# Altium schematic sheet ram.SchDoc
size A3; SheetNumber: 1; SheetTotal: 1
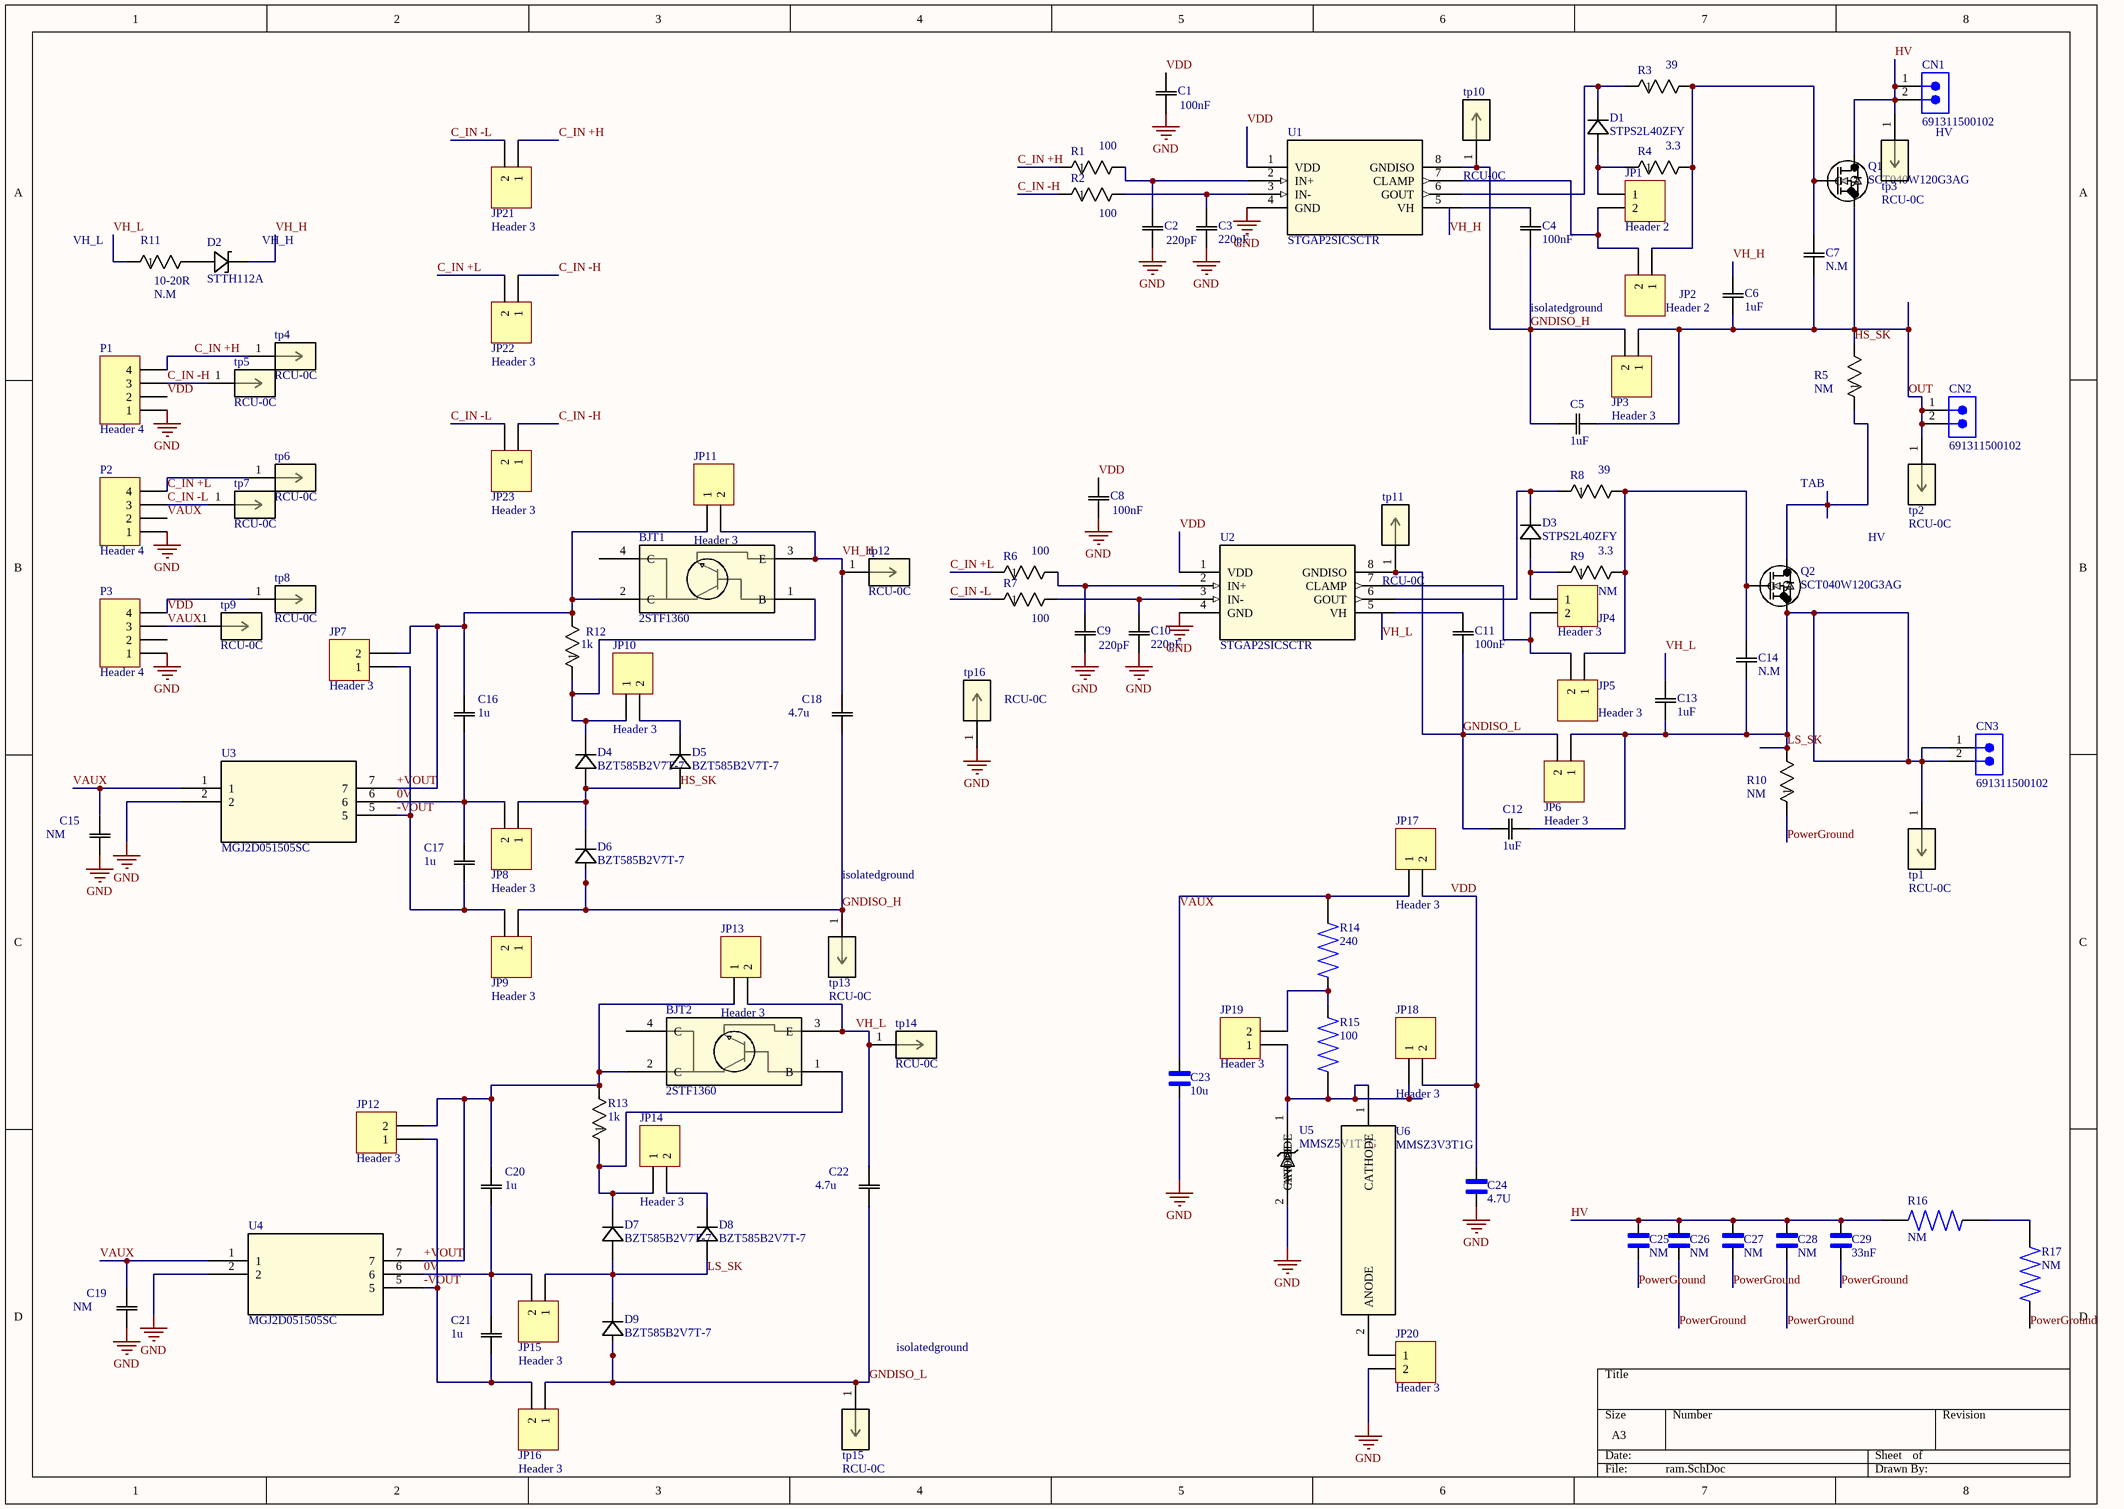
[diagram p0: ram.SchDoc]

## Parts
BJT1  2STF1360  [SOT-89_STM]
BJT2  2STF1360  [SOT-89_STM]
C1  100nF  [CAPC340180_88N_KEM]
C2  220pF  [CAPC340180_88N_KEM]
C3  220pF  [CAPC340180_88N_KEM]
C4  100nF  [CAPC340180_88N_KEM]
C5  1uF  [CAPC340180_88N_KEM]
C6  1uF  [CAPC340180_88N_KEM]
C7  N.M  [CAPC340180_88N_KEM]
C8  100nF  [CAPC340180_88N_KEM]
C9  220pF  [CAPC340180_88N_KEM]
C10  220pF  [CAPC340180_88N_KEM]
C11  100nF  [CAPC340180_88N_KEM]
C12  1uF  [CAPC340180_88N_KEM]
C13  1uF  [CAPC340180_88N_KEM]
C14  N.M  [CAPC340180_88N_KEM]
C15  NM  [CAPC340180_88N_KEM]
C16  1u  [CAPC340180_88N_KEM]
C17  1u  [CAPC340180_88N_KEM]
C18  4.7u  [CAPC340180_88N_KEM]
C19  NM  [CAPC340180_88N_KEM]
C20  1u  [CAPC340180_88N_KEM]
C21  1u  [CAPC340180_88N_KEM]
C22  4.7u  [CAPC340180_88N_KEM]
C23  10u  [CAPC3216X178]
C24  4.7U  [CAPC3216X178]
C25  NM  [CAPC3216X178]
C26  NM  [CAPC3216X178]
C27  NM  [CAPC3216X178]
C28  NM  [CAPC3216X178]
C29  33nF  [CAPC3216X178]
CN1  691311500102  [691311500102]
CN2  691311500102  [691311500102]
CN3  691311500102  [691311500102]
D1  STPS2L40ZFY  [CR_2L40ZFY_STM]
D2  STTH112A  [SMA_STM]
D3  STPS2L40ZFY  [CR_2L40ZFY_STM]
D4  BZT585B2V7T-7  [SOD523_DIO]
D5  BZT585B2V7T-7  [SOD523_DIO]
D6  BZT585B2V7T-7  [SOD523_DIO]
D7  BZT585B2V7T-7  [SOD523_DIO]
D8  BZT585B2V7T-7  [SOD523_DIO]
D9  BZT585B2V7T-7  [SOD523_DIO]
JP1  Header 2  [HDR1X2]
JP2  Header 2  [HDR1X2]
JP3  Header 3  [HDR1X2]
JP4  Header 3  [HDR1X2]
JP5  Header 3  [HDR1X2]
JP6  Header 3  [HDR1X2]
JP7  Header 3  [HDR1X2]
JP8  Header 3  [HDR1X2]
JP9  Header 3  [HDR1X2]
JP10  Header 3  [HDR1X2]
JP11  Header 3  [HDR1X2]
JP12  Header 3  [HDR1X2]
JP13  Header 3  [HDR1X2]
JP14  Header 3  [HDR1X2]
JP15  Header 3  [HDR1X2]
JP16  Header 3  [HDR1X2]
JP17  Header 3  [HDR1X2]
JP18  Header 3  [HDR1X2]
JP19  Header 3  [HDR1X2]
JP20  Header 3  [HDR1X2]
JP21  Header 3  [HDR1X2]
JP22  Header 3  [HDR1X2]
JP23  Header 3  [HDR1X2]
P1  Header 4  [HDR1X4]
P2  Header 4  [HDR1X4]
P3  Header 4  [HDR1X4]
Q1  SCT040W120G3AG  [QNMOS1G2D3S_HiP247_15p6x5p0-5p45_STM]
Q2  SCT040W120G3AG  [QNMOS1G2D3S_HiP247_15p6x5p0-5p45_STM]
R1  100  [RES_RC1210_3P1X2P6_YAG]
R2  100  [RES_RC1210_3P1X2P6_YAG]
R3  39  [RES_RC1210_3P1X2P6_YAG]
R4  3.3  [RES_RC1210_3P1X2P6_YAG]
R5  NM  [RES_RC1210_3P1X2P6_YAG]
R6  100  [RES_RC1210_3P1X2P6_YAG]
R7  100  [RES_RC1210_3P1X2P6_YAG]
R8  39  [RES_RC1210_3P1X2P6_YAG]
R9  3.3  [RES_RC1210_3P1X2P6_YAG]
R10  NM  [RES_RC1210_3P1X2P6_YAG]
R11  10-20R  [RES_RC1210_3P1X2P6_YAG]
R12  1k  [RES_RC1210_3P1X2P6_YAG]
R13  1k  [RES_RC1210_3P1X2P6_YAG]
R14  240  [RES_ERJ14BQF2R2U]
R15  100  [RES_ERJ14BQF2R2U]
R16  NM  [RES_ERJ14BQF2R2U]
R17  NM  [RES_ERJ14BQF2R2U]
tp1  RCU-0C  [CONN1_RCU-0C_TEC]
tp2  RCU-0C  [CONN1_RCU-0C_TEC]
tp3  RCU-0C  [CONN1_RCU-0C_TEC]
tp4  RCU-0C  [CONN1_RCU-0C_TEC]
tp5  RCU-0C  [CONN1_RCU-0C_TEC]
tp6  RCU-0C  [CONN1_RCU-0C_TEC]
tp7  RCU-0C  [CONN1_RCU-0C_TEC]
tp8  RCU-0C  [CONN1_RCU-0C_TEC]
tp9  RCU-0C  [CONN1_RCU-0C_TEC]
tp10  RCU-0C  [CONN1_RCU-0C_TEC]
tp11  RCU-0C  [CONN1_RCU-0C_TEC]
tp12  RCU-0C  [CONN1_RCU-0C_TEC]
tp13  RCU-0C  [CONN1_RCU-0C_TEC]
tp14  RCU-0C  [CONN1_RCU-0C_TEC]
tp15  RCU-0C  [CONN1_RCU-0C_TEC]
tp16  RCU-0C  [CONN1_RCU-0C_TEC]
U1  STGAP2SICSCTR  [SO8_7P59X6P05_STM]
U2  STGAP2SICSCTR  [SO8_7P59X6P05_STM]
U3  MGJ2D051505SC  [MGJ2_MUR]
U4  MGJ2D051505SC  [MGJ2_MUR]
U5  MMSZ5V1T1G  [SOD-123_ONS]
U6  MMSZ3V3T1G  [SOD-123_ONS]

## Nets
GND: C1.1 C2.1 C3.1 C8.1 C9.1 C10.1 C15.1 C19.1 C23.1 C24.1 JP20.2 P1.1 P2.1 P3.1 tp16.1 U1.4(GND) U2.4(GND) U3.2 U4.2 U5.2(ANODE)
0V: C16.1 C17.2 C20.1 C21.2 JP8.2 JP15.2 U3.6 U4.6
+VOUT: BJT1.2(C) BJT2.2(C) C16.2 C20.2 JP7.2 JP11.1 JP12.2 JP13.1 R12.2 R13.2 U3.7 U4.7
-VOUT: C17.1 C21.1 JP7.1 JP9.2 JP12.1 JP16.2 U3.5 U4.5
C_IN +H: JP21.1 P1.4 R1.1 tp4.1
C_IN +L: JP22.2 P2.4 R6.1 tp6.1
C_IN -H: JP22.1 JP23.1 P1.3 R2.1 tp5.1
C_IN -L: JP21.2 JP23.2 P2.3 R7.1 tp7.1
GNDISO_H: C4.1 C5.2 C18.1 D6.2 JP3.2 JP9.1 tp10.1 tp13.1 U1.8(GNDISO)
GNDISO_L: C11.1 C12.2 C22.1 D9.2 JP6.2 JP16.1 tp11.1 tp15.1 U2.8(GNDISO)
HS_SK: C5.1 C6.2 C7.2 CN2.1 CN2.2 D4.2 D5.2 D6.1 JP3.1 JP8.1 Q1.3(S) R5.2 tp2.1  [also labelled OUT]
HV: C25.2 C26.2 C27.2 C28.2 C29.2 CN1.1 CN1.2 Q1.2(D) R16.2 tp3.1
LS_SK: C12.1 C13.2 C14.2 CN3.1 CN3.2 D7.2 D8.2 D9.1 JP6.1 JP15.1 Q2.3(S) R10.2 tp1.1
PowerGround: C25.1 C26.1 C27.1 C28.1 C29.1 R10.1 R17.1
VAUX: C15.2 C19.2 C23.2 JP17.1 P2.2 P3.3 R14.2 tp9.1 U3.1 U4.1
VDD: C1.2 C8.2 C24.2 JP17.2 JP18.2 P1.2 P3.4 tp8.1 U1.1(VDD) U2.1(VDD)
VH_H: BJT1.3(E) C6.1 C18.2 D2.2(A) JP11.2 tp12.1
VH_L: BJT2.3(E) C13.1 C22.2 JP13.2 R11.1 tp14.1
NetBJT1_1: BJT1.1(B) D4.1 JP10.1 R12.1
NetBJT2_1: BJT2.1(B) D7.1 JP14.1 R13.1
NetC2_2: C2.2 R1.2 U1.2(IN+)
NetC3_2: C3.2 R2.2 U1.3(IN-)
NetC4_2: C4.2 U1.5(VH)
NetC7_1: C7.1 JP2.1 Q1.1(G) R3.2 R4.2
NetC9_2: C9.2 R6.2 U2.2(IN+)
NetC10_2: C10.2 R7.2 U2.3(IN-)
NetC11_2: C11.2 U2.5(VH)
NetC14_1: C14.1 JP5.1 Q2.1(G) R8.2 R9.2
NetD1_1: D1.1 R3.1 U1.6(GOUT)
NetD1_2: D1.2 JP1.1 R4.1
NetD2_1: D2.1(K) R11.2
NetD3_1: D3.1 R8.1 U2.6(GOUT)
NetD3_2: D3.2 JP4.1 R9.1
NetD5_1: D5.1 JP10.2
NetD8_1: D8.1 JP14.2
NetJP1_2: JP1.2 JP2.2 U1.7(CLAMP)
NetJP4_2: JP4.2 JP5.2 U2.7(CLAMP)
NetJP18_1: JP18.1 JP19.1 R15.1 U5.1(CATHODE) U6.1(CATHODE)
NetJP19_2: JP19.2 R14.1 R15.2
NetJP20_1: JP20.1 U6.2(ANODE)
NetQ2_2: Q2.2(D) R5.1
NetR16_1: R16.1 R17.2

Not connected (* = marked no-connect by the designer): BJT1 4(C); BJT2 4(C); P3 2

## Notes on the sheet
- HV
- (near R11) VH_L
- (near D2) VH_H
- (near R11) N.M
- isolatedground
- TAB
- (near R9) NM

## Library data of the parts
BJT1 BJT2 = 2STF1360: Low voltage fast-switching NPN power transistor; Manufacturer_Name: STMicroelectronics; Copyright: Copyright (C) 2025 Ultra Librarian. All rights reserved.; Manufacturer_Part_Number: 2STF1360; RefDes: RefDes; Type: Type
C1-C22 = C1206C100J5GACTU: SMD Comm C0G, Ceramic, 10 pF, 5%, 50 VDC, C0G, SMD, MLCC, Ultra-Stable, Low Loss, Class I, 1206; Manufacturer_Name: Kemet; Copyright: Copyright (C) 2025 Ultra Librarian. All rights reserved.; Manufacturer_Part_Number: C1206C100J5GACTU
C23-C29 = 12063C105KAT2A: 1 ÂµF Â±10% 25V Ceramic Capacitor X7R 1206 (3216 Metric); MF: KYOCERA AVX Components Corporation; SnapEDA_Link: https://www.snapeda.com/parts/12063C105KAT2A/Kyocera/view-part/?ref=snap; Package: 1206-2 KEMET; Value: *; MP: 12063C105KAT2A; Check_prices: https://www.snapeda.com/parts/12063C105KAT2A/Kyocera/view-part/?ref=eda
CN1-CN3 = 691311500102: WR-TBL Series 311 Close Vertical PCB Header, THT, pitch 5.08mm, 02p; Manufacturer: Wurth Elektronik; Modularity: No; Rated Current: 20A; System: Pluggable Connector; Working Voltage: 300V; Manufacturer Part Number: 691311500102; Category: Terminal Block; Match Code: WR-TBL; ComponentLink1Description: Website Link; ComponentLink1URL: https://www.we-online.com/redexpert/article/691311500102?ad; ComponentLink2Description: Datasheet Link; ComponentLink2URL: https://www.we-online.com/redexpert/spec/691311500102?ad; Mount: Through Hole; Min Operating Temperature: -40°C; Max Operating Temperature: 105°C; Packaging: Box; Application: Pluggable; Number of Pins: 2; Number of Rows: 1; Orientation: Vertical; Pitch: 5.08mm
D1 D3 = STPS2L40ZFY: Automotive 40 V, 2 A Low Drop Power Schottky Rectifier; Manufacturer_Name: STMicroelectronics; Copyright: Copyright (C) 2026 Ultra Librarian. All rights reserved.; Manufacturer_Part_Number: STPS2L40ZFY
D2 = STTH112A: 1200 V, 1A Ultrafast Diode; Manufacturer_Name: STMicroelectronics; Copyright: Copyright (C) 2025 Ultra Librarian. All rights reserved.; Manufacturer_Part_Number: STTH112A
D4-D9 = BZT585B2V7T-7: Description; Manufacturer_Name: Diodes Inc; Copyright: Copyright (C) 2025 Ultra Librarian. All rights reserved.; Manufacturer_Part_Number: BZT585B2V7T-7
JP1-JP23 = Header 2: Header, 2-Pin; LatestRevisionDate: 17-Jul-2002; LatestRevisionNote: Re-released for DXP Platform.; Publisher: Altium Limited
P1-P3 = Header 4: Header, 4-Pin; LatestRevisionDate: 17-Jul-2002; LatestRevisionNote: Re-released for DXP Platform.; Publisher: Altium Limited
Q1 Q2 = SCT040W120G3AG: Automotive-grade silicon carbide Power MOSFET 1200 V, 40 mOhm typ., 40 A in an HiP247 package; Manufacturer_Name: STMicroelectronics; Type: Transistors; Copyright: Copyright (C) 2025 Ultra Librarian. All rights reserved.; Manufacturer_Part_Number: SCT040W120G3AG
R1-R13 = RC1210FR-071RL: No Description Available; Manufacturer_Name: Yageo; Copyright: Copyright (C) 2026 Ultra Librarian. All rights reserved.; Manufacturer_Part_Number: RC1210FR-071RL
R14-R17 = ERJ14BQF2R2U: Package: None; MP: ERJ14BQF2R2U; Value: *; Price: None; Availability: Unavailable
tp1-tp16 = RCU-0C: 0603 PROBE PAD; Manufacturer_Name: TE Connectivity; Copyright: Copyright (C) 2025 Ultra Librarian. All rights reserved.; Manufacturer_Part_Number: RCU-0C; RefDes: RefDes; Type: Type
U1 U2 = STGAP2SICSCTR: Galvanically isolated 4 A single gate driver for SiC MOSFETs; Manufacturer_Name: STMicroelectronics; Copyright: Copyright (C) 2026 Ultra Librarian. All rights reserved.; Manufacturer_Part_Number: STGAP2SICSCTR; RefDes: RefDes; Type: Type
U3 U4 = MGJ2D051505SC: Description; Manufacturer_Name: Murata; Copyright: Copyright (C) 2025 Ultra Librarian. All rights reserved.; Manufacturer_Part_Number: MGJ2D051505SC; RefDes: RefDes; Type: Type
U5 = MMSZ5V1T1G: Description; Manufacturer_Name: onsemi; Copyright: Copyright (C) 2025 Ultra Librarian. All rights reserved.; Manufacturer_Part_Number: MMSZ5V1T1G; RefDes: RefDes; Type: Type
U6 = MMSZ3V3T1G: Description; Manufacturer_Name: onsemi; Copyright: Copyright (C) 2025 Ultra Librarian. All rights reserved.; Manufacturer_Part_Number: MMSZ3V3T1G; RefDes: RefDes; Type: Type